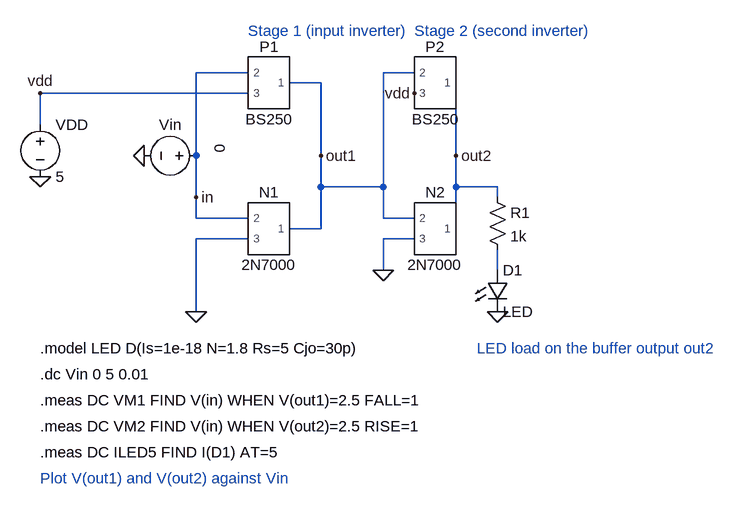
[diagram p0: schematic Buffer_DC.asc]
Buffer_DC.asc, the LTspice schematic file:
Version 4.1
SHEET 1 1216 760
WIRE -240 16 -320 16
WIRE -128 32 -176 32
WIRE -240 48 -560 48
WIRE -560 96 -560 48
WIRE -320 144 -320 16
WIRE -128 144 -128 32
WIRE -128 192 -128 144
WIRE -320 208 -320 144
WIRE -320 240 -320 208
WIRE -240 240 -320 240
WIRE -128 256 -128 192
WIRE -128 256 -176 256
WIRE -240 272 -320 272
WIRE -320 384 -320 272
WIRE -128 192 -32 192
WIRE -32 16 -32 192
WIRE -32 192 -32 240
WIRE 16 16 -32 16
WIRE 16 240 -32 240
WIRE 16 272 -32 272
WIRE -32 272 -32 320
WIRE 80 32 80 144
WIRE 80 144 80 192
WIRE 80 192 80 256
WIRE 80 192 144 192
WIRE 144 192 144 208
WIRE 144 288 144 320
FLAG -320 384 0
FLAG -400 144 0
FLAG -560 176 0
FLAG -128 144 out1
FLAG -320 208 in
FLAG -32 320 0
FLAG 144 384 0
FLAG 80 144 out2
FLAG 16 48 vdd
FLAG -560 48 vdd
SYMBOL 2N7000 -208 256 M0
SYMATTR InstName N1
SYMBOL BS250 -208 32 M0
SYMATTR InstName P1
SYMBOL 2N7000 48 256 M0
SYMATTR InstName N2
SYMBOL BS250 48 32 M0
SYMATTR InstName P2
SYMBOL voltage -304 144 R90
WINDOW 0 -32 56 VBottom 2
WINDOW 3 -11 -5 Bottom 2
WINDOW 123 0 0 Left 0
WINDOW 39 0 0 Left 0
SYMATTR InstName Vin
SYMATTR Value 0
SYMBOL voltage -560 80 R0
WINDOW 123 0 0 Left 0
WINDOW 39 0 0 Left 0
SYMATTR InstName VDD
SYMATTR Value 5
SYMBOL res 128 192 R0
SYMATTR InstName R1
SYMATTR Value 1k
SYMBOL LED 128 320 R0
SYMATTR InstName D1
SYMATTR Value LED
TEXT -240 -48 Left 2 ;Stage 1 (input inverter)
TEXT 16 -48 Left 2 ;Stage 2 (second inverter)
TEXT 112 440 Left 2 ;LED load on the buffer output out2
TEXT -560 440 Left 2 !.model LED D(Is=1e-18 N=1.8 Rs=5 Cjo=30p)
TEXT -560 480 Left 2 !.dc Vin 0 5 0.01
TEXT -560 520 Left 2 !.meas DC VM1 FIND V(in) WHEN V(out1)=2.5 FALL=1
TEXT -560 560 Left 2 !.meas DC VM2 FIND V(in) WHEN V(out2)=2.5 RISE=1
TEXT -560 600 Left 2 !.meas DC ILED5 FIND I(D1) AT=5
TEXT -560 640 Left 2 ;Plot V(out1) and V(out2) against Vin

The netlist it stands for:
* Buffer_DC.asc
X§N1 out1 in 0 2N7000  ; pins 1 2 3
X§P1 out1 in vdd BS250  ; pins 1 2 3
X§N2 out2 out1 0 2N7000  ; pins 1 2 3
X§P2 out2 out1 vdd BS250  ; pins 1 2 3
Vin in 0 0
VDD vdd 0 5
R1 out2 N001 1k
D1 N001 0 LED
.model D D
.lib standard.dio
* Stage 1 (input inverter)
* Stage 2 (second inverter)
* LED load on the buffer output out2
.model LED D(Is=1e-18 N=1.8 Rs=5 Cjo=30p)
.dc Vin 0 5 0.01
.meas DC VM1 FIND V(in) WHEN V(out1)=2.5 FALL=1
.meas DC VM2 FIND V(in) WHEN V(out2)=2.5 RISE=1
.meas DC ILED5 FIND I(D1) AT=5
* Plot V(out1) and V(out2) against Vin
.lib 2N7000.onsemi.lib
.lib BS250.philips.lib
.backanno
.end